# Altium schematic sheet RP2350.SchDoc
size B; SheetNumber: 1; SheetTotal: 5
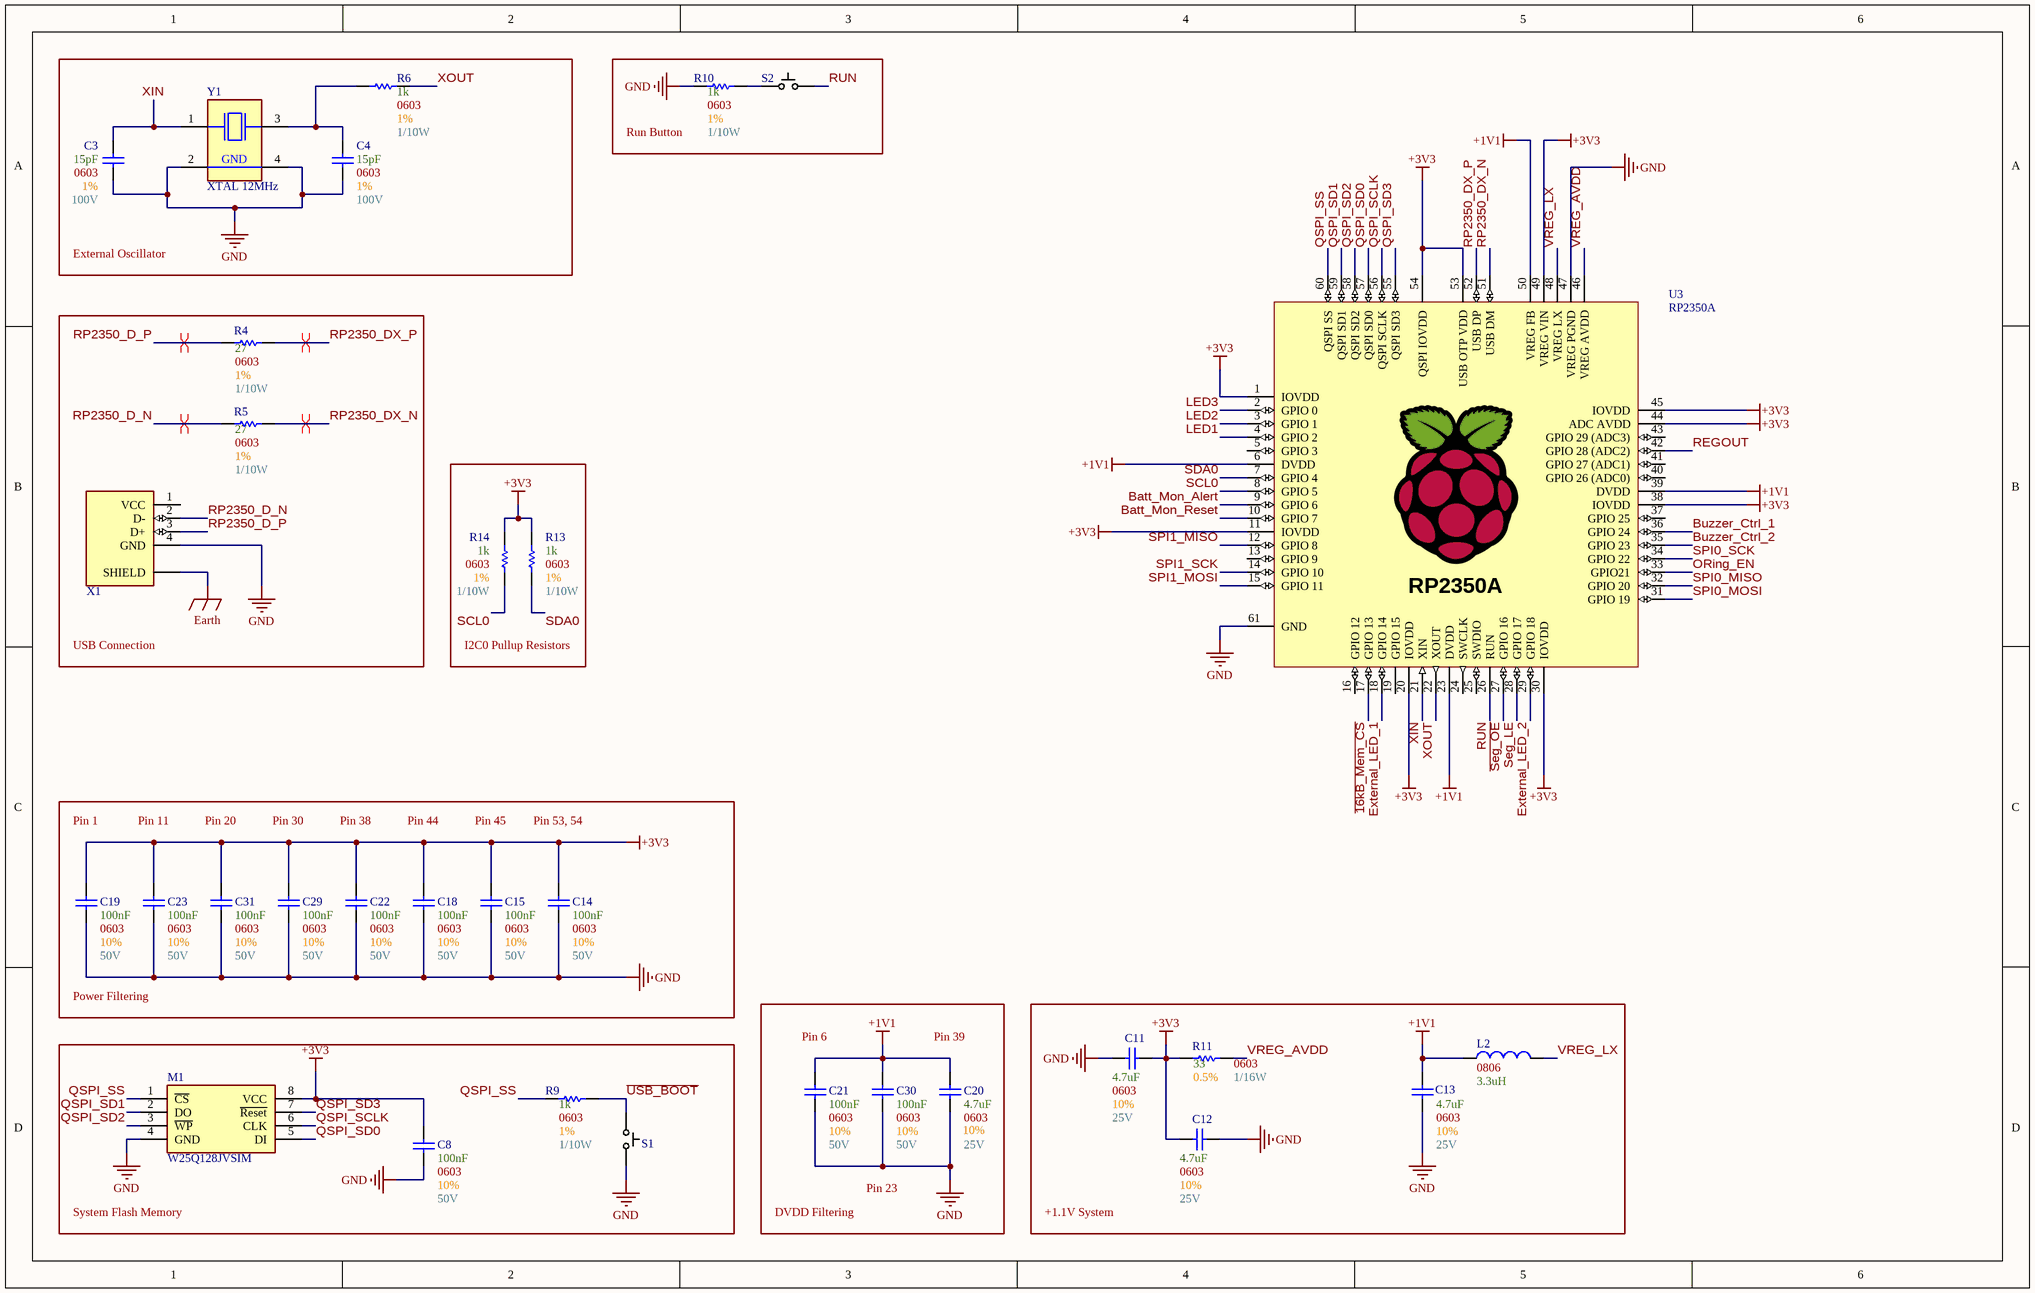
[diagram p0: RP2350.SchDoc]

## Parts
C3  Max Voltage: 100V  Size Package: 0603  Tolerance: 1%  Capacitance: 15pF  [[Cap] SMD 0603]  (hidden comment: [Cap] 0603 15pF 1% 100V)
C4  Max Voltage: 100V  Size Package: 0603  Tolerance: 1%  Capacitance: 15pF  [[Cap] SMD 0603]  (hidden comment: [Cap] 0603 15pF 1% 100V)
C8  Max Voltage: 50V  Size Package: 0603  Tolerance: 10%  Capacitance: 100nF  [[Cap] SMD 0603]  (hidden comment: [Cap] 0603 0.1uF 10% 50V)
C11  Max Voltage: 25V  Size Package: 0603  Tolerance: 10%  Capacitance: 4.7uF  [[Cap] SMD 0603]  (hidden comment: [Cap] 0603 4.7uF 10% 25V)
C12  Max Voltage: 25V  Size Package: 0603  Tolerance: 10%  Capacitance: 4.7uF  [[Cap] SMD 0603]  (hidden comment: [Cap] 0603 4.7uF 10% 25V)
C13  Max Voltage: 25V  Size Package: 0603  Tolerance: 10%  Capacitance: 4.7uF  [[Cap] SMD 0603]  (hidden comment: [Cap] 0603 4.7uF 10% 25V)
C14  Max Voltage: 50V  Size Package: 0603  Tolerance: 10%  Capacitance: 100nF  [[Cap] SMD 0603]  (hidden comment: [Cap] 0603 0.1uF 10% 50V)
C15  Max Voltage: 50V  Size Package: 0603  Tolerance: 10%  Capacitance: 100nF  [[Cap] SMD 0603]  (hidden comment: [Cap] 0603 0.1uF 10% 50V)
C18  Max Voltage: 50V  Size Package: 0603  Tolerance: 10%  Capacitance: 100nF  [[Cap] SMD 0603]  (hidden comment: [Cap] 0603 0.1uF 10% 50V)
C19  Max Voltage: 50V  Size Package: 0603  Tolerance: 10%  Capacitance: 100nF  [[Cap] SMD 0603]  (hidden comment: [Cap] 0603 0.1uF 10% 50V)
C20  Max Voltage: 25V  Size Package: 0603  Tolerance: 10%  Capacitance: 4.7uF  [[Cap] SMD 0603]  (hidden comment: [Cap] 0603 4.7uF 10% 25V)
C21  Max Voltage: 50V  Size Package: 0603  Tolerance: 10%  Capacitance: 100nF  [[Cap] SMD 0603]  (hidden comment: [Cap] 0603 0.1uF 10% 50V)
C22  Max Voltage: 50V  Size Package: 0603  Tolerance: 10%  Capacitance: 100nF  [[Cap] SMD 0603]  (hidden comment: [Cap] 0603 0.1uF 10% 50V)
C23  Max Voltage: 50V  Size Package: 0603  Tolerance: 10%  Capacitance: 100nF  [[Cap] SMD 0603]  (hidden comment: [Cap] 0603 0.1uF 10% 50V)
C29  Max Voltage: 50V  Size Package: 0603  Tolerance: 10%  Capacitance: 100nF  [[Cap] SMD 0603]  (hidden comment: [Cap] 0603 0.1uF 10% 50V)
C30  Max Voltage: 50V  Size Package: 0603  Tolerance: 10%  Capacitance: 100nF  [[Cap] SMD 0603]  (hidden comment: [Cap] 0603 0.1uF 10% 50V)
C31  Max Voltage: 50V  Size Package: 0603  Tolerance: 10%  Capacitance: 100nF  [[Cap] SMD 0603]  (hidden comment: [Cap] 0603 0.1uF 10% 50V)
L2  Package: 0806  Inductance: 3.3uH  [[Inductor] SMD 0806]  (hidden comment: [3.3uH] SMD 0806 2.1A)
M1  W25Q128JVSIM  [[Flash] 128MBit]
R4  Wattage: 1/10W  Tolerance: 1%  Resistance: 27  Size Package: 0603  [[Res] SMD 0603]  (hidden comment: [27] SMD 0603 1% 1/10W)
R5  Wattage: 1/10W  Tolerance: 1%  Resistance: 27  Size Package: 0603  [[Res] SMD 0603]  (hidden comment: [27] SMD 0603 1% 1/10W)
R6  Wattage: 1/10W  Tolerance: 1%  Resistance: 1k  Size Package: 0603  [[Res] SMD 0603]  (hidden comment: [1k] SMD 0603 1% 1/10W)
R9  Wattage: 1/10W  Tolerance: 1%  Resistance: 1k  Size Package: 0603  [[Res] SMD 0603]  (hidden comment: [1k] SMD 0603 1% 1/10W)
R10  Wattage: 1/10W  Tolerance: 1%  Resistance: 1k  Size Package: 0603  [[Res] SMD 0603]  (hidden comment: [1k] SMD 0603 1% 1/10W)
R11  Wattage: 1/16W  Tolerance: 0.5%  Resistance: 33  Size Package: 0603  [[Res] SMD 0603]  (hidden comment: [33] SMD 0603 0.5% 1/16W)
R13  Wattage: 1/10W  Tolerance: 1%  Resistance: 1k  Size Package: 0603  [[Res] SMD 0603]  (hidden comment: [1k] SMD 0603 1% 1/10W)
R14  Wattage: 1/10W  Tolerance: 1%  Resistance: 1k  Size Package: 0603  [[Res] SMD 0603]  (hidden comment: [1k] SMD 0603 1% 1/10W)
S1  [SPST] SMD Pushbutton  [[SPST] SMD Pushbutton]  (value not drawn)
S2  [SPST] SMD Pushbutton  [[SPST] SMD Pushbutton]  (value not drawn)
U3  RP2350A  [[MCU] RP2350A]
X1  USB-B-S-VT  [[USB] Type-B Vertical]  (value not drawn)
Y1  XTAL 12MHz  [[Crystal] SMD 12MHz]

## Blocks framed on the sheet
External Oscillator: C3 C4 R6 Y1
Run Button: R10 S2
USB Connection: R4 R5 X1
I2C0 Pullup Resistors: R13 R14
+1.1V System: C11-C13 L2 R11
System Flash Memory: C8 M1 R9 S1

## Nets
+1V1: C13.1 C20.2 C21.2 C30.2 L2.1 U3.6(DVDD) U3.23(DVDD) U3.39(DVDD) U3.50(VREG_FB)
+3V3: C8.2 C11.1 C12.2 C14.2 C15.2 C18.2 C19.2 C22.2 C23.2 C29.2 C31.2 M1.8(VCC) R11.1 R13.2 R14.2 U3.1(IOVDD) U3.11(IOVDD) U3.20(IOVDD) U3.30(IOVDD) U3.38(IOVDD) U3.44(ADC_AVDD) U3.45(IOVDD) U3.49(VREG_VIN) U3.53(USB_OTP_VDD) U3.54(QSPI_IOVDD)
Earth: X1.MH(SHIELD)
GND: C3.1 C4.1 C8.1 C11.2 C12.1 C13.2 C14.1 C15.1 C18.1 C19.1 C20.1 C21.1 C22.1 C23.1 C29.1 C30.1 C31.1 M1.4(GND) R10.1 S1.2 U3.47(VREG_PGND) U3.61(GND) X1.4(GND) Y1.2(GND) Y1.4(GND)
~{16kB_Mem_CS}: U3.17(GPIO_13)
~{Seg_OE}: U3.27(GPIO_16)
Batt_Mon_Alert: U3.9(GPIO_6)
Batt_Mon_Reset: U3.10(GPIO_7)
Buzzer_Ctrl_1: U3.36(GPIO_24)
Buzzer_Ctrl_2: U3.35(GPIO_23)
External_LED_1: U3.18(GPIO_14)
External_LED_2: U3.29(GPIO_18)
LED1: U3.4(GPIO_2)
LED2: U3.3(GPIO_1)
LED3: U3.2(GPIO_0)
ORing_EN: U3.33(GPIO21)
QSPI_SCLK: M1.6(CLK) U3.56(QSPI_SCLK)
QSPI_SD0: M1.5(DI) U3.57(QSPI_SD0)
QSPI_SD1: M1.2(DO) U3.59(QSPI_SD1)
QSPI_SD2: M1.3(~{WP}) U3.58(QSPI_SD2)
QSPI_SD3: M1.7(~{Reset}) U3.55(QSPI_SD3)
QSPI_SS: M1.1(~{CS}) R9.1 U3.60(QSPI_SS)
REGOUT: U3.42(GPIO_28_(ADC2))
RP2350_D_N: R5.1 X1.2(D-)
RP2350_D_P: R4.1 X1.3(D+)
RP2350_DX_N: R5.2 U3.51(USB_DM)
RP2350_DX_P: R4.2 U3.52(USB_DP)
RUN: S2.2 U3.26(RUN)
SCL0: R14.1 U3.8(GPIO_5)
SDA0: R13.1 U3.7(GPIO_4)
Seg_LE: U3.28(GPIO_17)
SPI0_MISO: U3.32(GPIO_20)
SPI0_MOSI: U3.31(GPIO_19)
SPI0_SCK: U3.34(GPIO_22)
SPI1_MISO: U3.12(GPIO_8)
SPI1_MOSI: U3.15(GPIO_11)
SPI1_SCK: U3.14(GPIO_10)
~{USB_BOOT}: R9.2 S1.1
VREG_AVDD: R11.2 U3.46(VREG_AVDD)
VREG_LX: L2.2 U3.48(VREG_LX)
XIN: C3.2 U3.21(XIN) Y1.1(XTAL1)
XOUT: R6.2 U3.22(XOUT)
NetC4_2: C4.2 R6.1 Y1.3(XTAL2)
NetR10_2: R10.2 S2.1

Not connected (* = marked no-connect by the designer): U3 5(GPIO_3) 13(GPIO_9) 16(GPIO_12) 19(GPIO_15) 24(SWCLK) 25(SWDIO) 37(GPIO_25) 40(GPIO_26_(ADC0)) 41(GPIO_27_(ADC1)) 43(GPIO_29_(ADC3)); X1 1(VCC)

## Layout directives
differential pair; differential pair class USB_Pairs: RP2350_D_N, RP2350_D_P, RP2350_DX_N, RP2350_DX_P

## Notes on the sheet
- Pin 1
- Pin 11
- Pin 20
- Pin 30
- Pin 38
- Pin 44
- Pin 45
- Pin 53, 54
- Power Filtering
- (near C21) Pin 6
- Pin 39
- Pin 23
- DVDD Filtering

## Library data of the parts
C3 C4 = [Cap] 0603 15pF 1% 100V: GCM1885C2A150FA16D; Supplier 1: DigiKey; Supplier Part Number 1: 490-16416-1-ND
C8 C14 C15 C18 C19 C21-C23 C29-C31 = [Cap] 0603 0.1uF 10% 50V: CL10B104KB8NNNC; Supplier 1: DigiKey; Supplier Part Number 1: 1276-1000-6-ND
C11-C13 C20 = [Cap] 0603 4.7uF 10% 25V: GRM188R61E475KE11D; Supplier 1: DigiKey; Supplier Part Number 1: 490-7203-6-ND
L2 = [3.3uH] SMD 0806 2.1A: AOTA-B201610S3R3-101-T; Supplier 1: DigiKey; Supplier Part Number 1: 535-AOTA-B201610S3R3-101-TCT-ND
M1 = [Flash] 128MBit: Supplier 1: DigiKey; Supplier Part Number 1: W25Q128JVSIM-ND
R4 R5 = [27] SMD 0603 1% 1/10W: MCT06030C2709FP500; Supplier 1: DigiKey; Supplier Part Number 1: 749-1631-1-ND
R6 R9 R10 R13 R14 = [1k] SMD 0603 1% 1/10W: RMCF0603FT1K00; Supplier 1: DigiKey; Supplier Part Number 1: RMCF0603FT1K00DKR-ND
R11 = [33] SMD 0603 0.5% 1/16W: RR0816Q-330-D; Supplier 1: DigiKey; Supplier Part Number 1: RR08Q33DDKR-ND
S1 S2 = [SPST] SMD Pushbutton: PTS815SJM250SMTRLFS; Supplier 1: DigiKey; Supplier Part Number 1: CKN12215-6-ND
U3 = [MCU] RP2350A: QFN-60 Package; Supplier 1: DigiKey; Supplier Part Number 1: 2648-SC1509-A4CT-ND
X1 = [USB] Type-B Vertical: Supplier 1: DigiKey; Supplier Part Number 1: 2057-USB-B-S-VT-ND
Y1 = [Crystal] SMD 12MHz: 815-ABM8-272-T3; Supplier 1: DigiKey; Supplier Part Number 1: 535-ABM8-272-T3CT-ND